# EAGLE design mem1 (EAGLE 4.13)
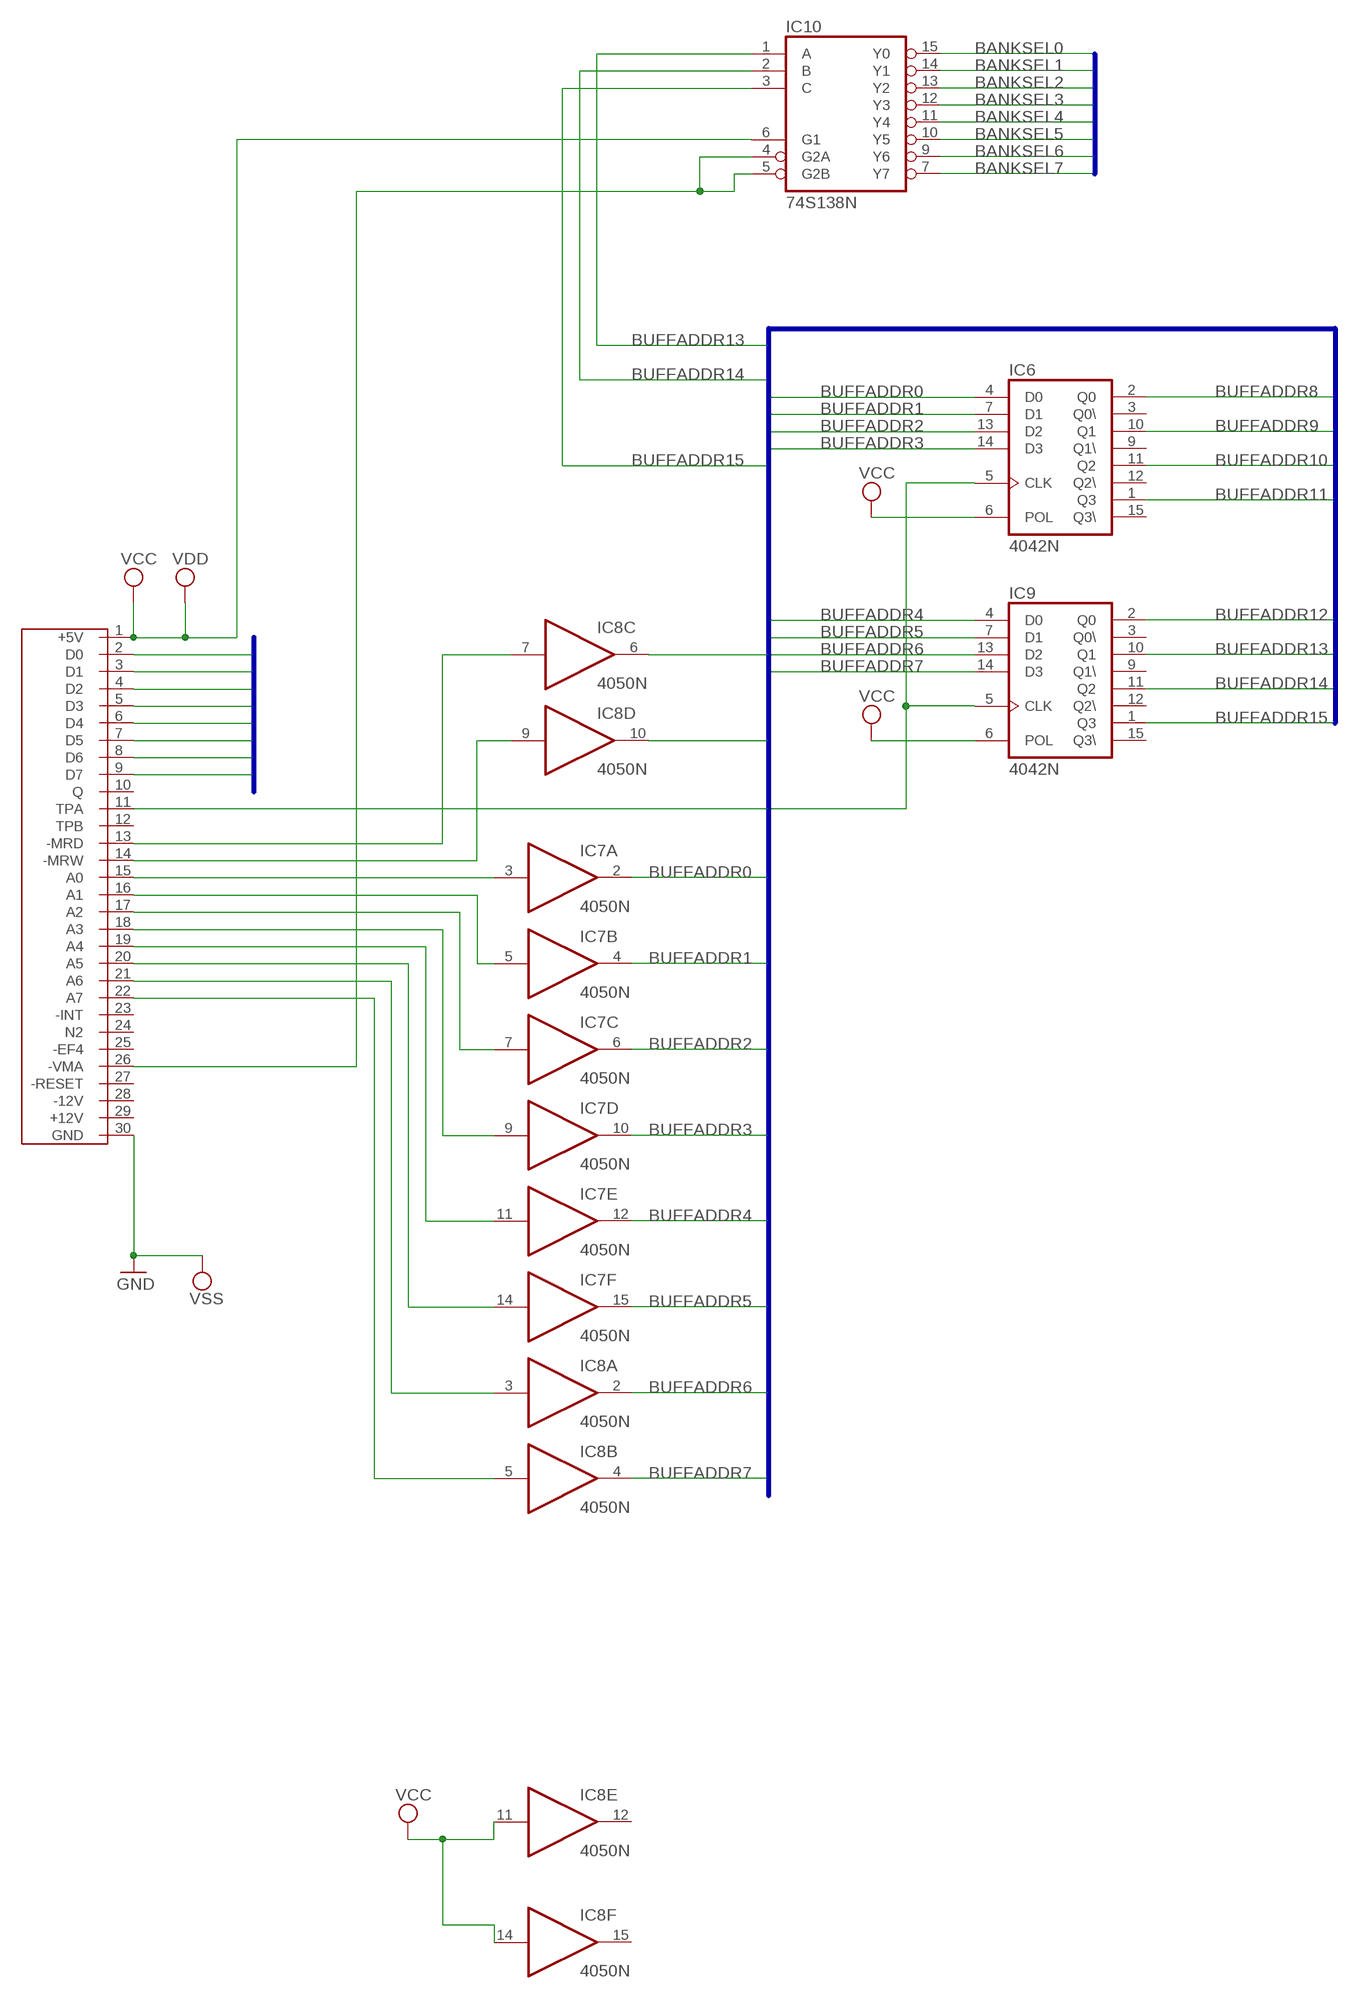
[diagram p0: schematic, sheet 1, part 1 of 2]
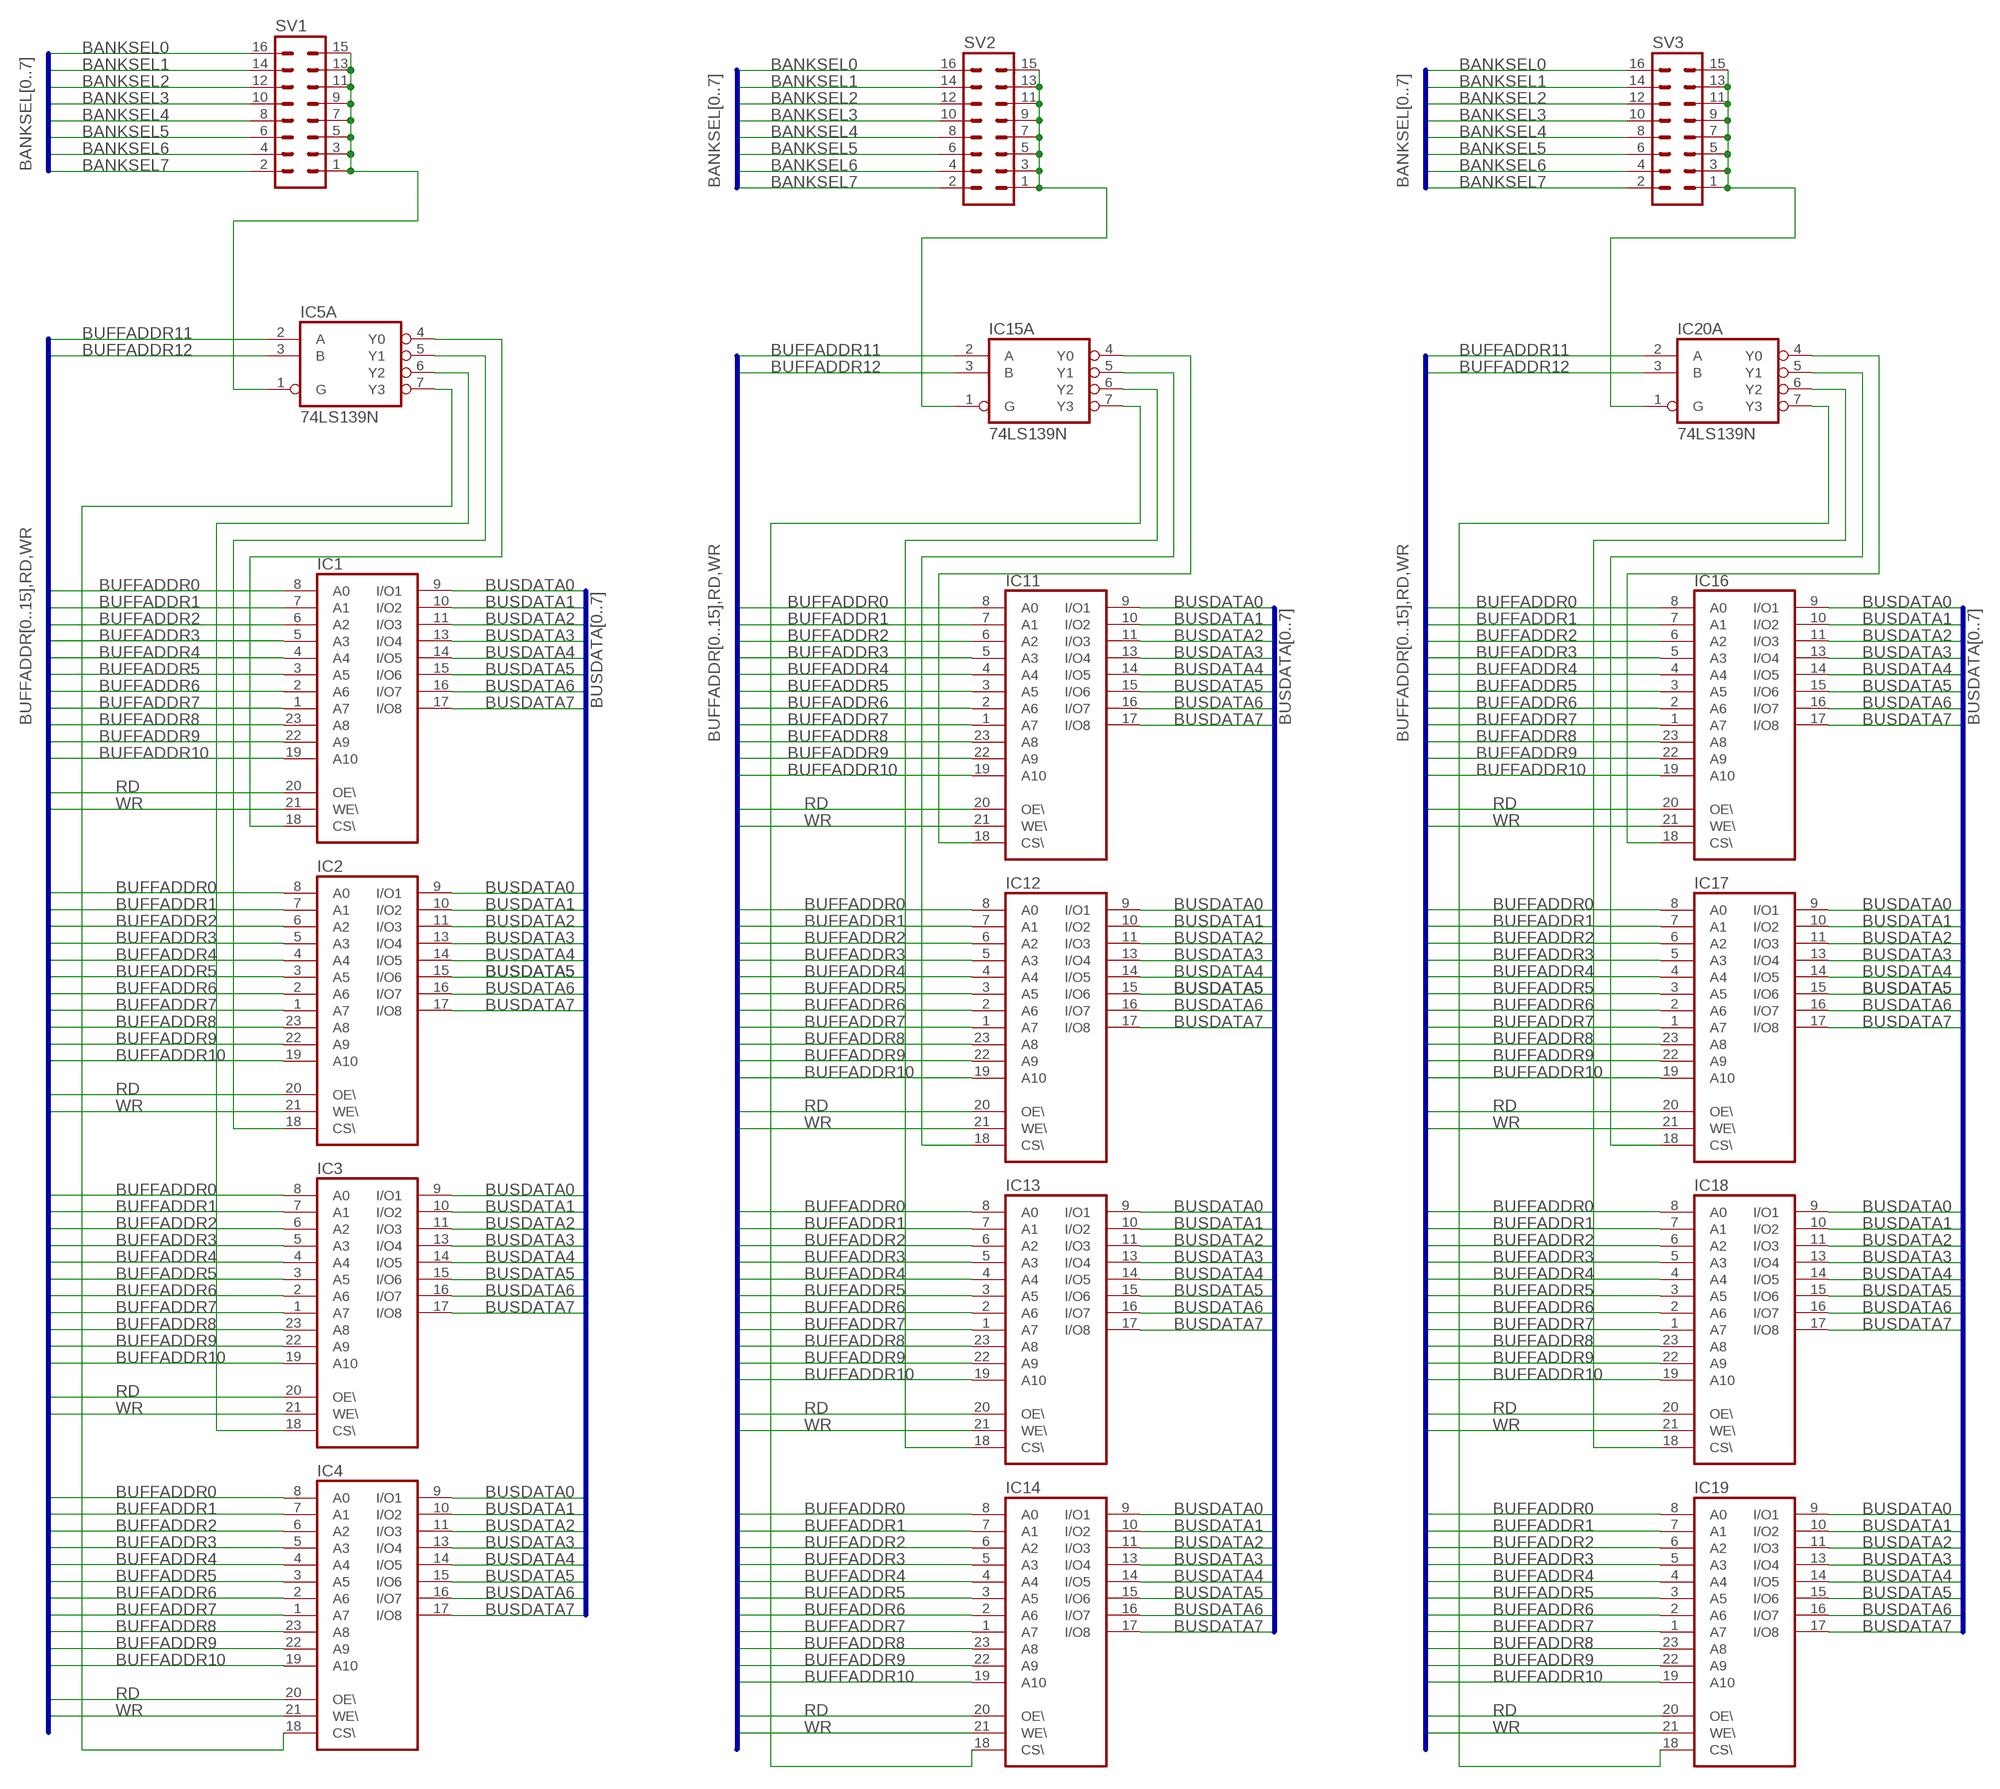
[diagram p1: schematic, sheet 1, part 2 of 2]

## Parts
IC1  6116P  [DIL24-6]
IC2  6116P  [DIL24-6]
IC3  6116P  [DIL24-6]
IC4  6116P  [DIL24-6]
IC5  74LS139N  [DIL16]
IC6  4042N  [DIL16]
IC7  4050N  [DIL16]
IC8  4050N  [DIL16]
IC9  4042N  [DIL16]
IC10  74S138N  [DIL16]
IC11  6116P  [DIL24-6]
IC12  6116P  [DIL24-6]
IC13  6116P  [DIL24-6]
IC14  6116P  [DIL24-6]
IC15  74LS139N  [DIL16]
IC16  6116P  [DIL24-6]
IC17  6116P  [DIL24-6]
IC18  6116P  [DIL24-6]
IC19  6116P  [DIL24-6]
IC20  74LS139N  [DIL16]
SV1  MA08-2  [MA08-2]
SV2  MA08-2  [MA08-2]
SV3  MA08-2  [MA08-2]
U$1  C30  [C30]

## Nets
BANKSEL0: IC10.15(Y0) SV1.16 SV2.16 SV3.16
BANKSEL1: IC10.14(Y1) SV1.14 SV2.14 SV3.14
BANKSEL2: IC10.13(Y2) SV1.12 SV2.12 SV3.12
BANKSEL3: IC10.12(Y3) SV1.10 SV2.10 SV3.10
BANKSEL4: IC10.11(Y4) SV1.8 SV2.8 SV3.8
BANKSEL5: IC10.10(Y5) SV1.6 SV2.6 SV3.6
BANKSEL6: IC10.9(Y6) SV1.4 SV2.4 SV3.4
BANKSEL7: IC10.7(Y7) SV1.2 SV2.2 SV3.2
BUFFADDR0: IC1.8(A0) IC2.8(A0) IC3.8(A0) IC4.8(A0) IC6.4(D0) IC7.2(A:O) IC11.8(A0) IC12.8(A0) IC13.8(A0) IC14.8(A0) IC16.8(A0) IC17.8(A0) IC18.8(A0) IC19.8(A0)
BUFFADDR1: IC1.7(A1) IC2.7(A1) IC3.7(A1) IC4.7(A1) IC6.7(D1) IC7.4(B:O) IC11.7(A1) IC12.7(A1) IC13.7(A1) IC14.7(A1) IC16.7(A1) IC17.7(A1) IC18.7(A1) IC19.7(A1)
BUFFADDR2: IC1.6(A2) IC2.6(A2) IC3.6(A2) IC4.6(A2) IC6.13(D2) IC7.6(C:O) IC11.6(A2) IC12.6(A2) IC13.6(A2) IC14.6(A2) IC16.6(A2) IC17.6(A2) IC18.6(A2) IC19.6(A2)
BUFFADDR3: IC1.5(A3) IC2.5(A3) IC3.5(A3) IC4.5(A3) IC6.14(D3) IC7.10(D:O) IC11.5(A3) IC12.5(A3) IC13.5(A3) IC14.5(A3) IC16.5(A3) IC17.5(A3) IC18.5(A3) IC19.5(A3)
BUFFADDR4: IC1.4(A4) IC2.4(A4) IC3.4(A4) IC4.4(A4) IC7.12(E:O) IC9.4(D0) IC11.4(A4) IC12.4(A4) IC13.4(A4) IC14.4(A4) IC16.4(A4) IC17.4(A4) IC18.4(A4) IC19.4(A4)
BUFFADDR5: IC1.3(A5) IC2.3(A5) IC3.3(A5) IC4.3(A5) IC7.15(F:O) IC9.7(D1) IC11.3(A5) IC12.3(A5) IC13.3(A5) IC14.3(A5) IC16.3(A5) IC17.3(A5) IC18.3(A5) IC19.3(A5)
BUFFADDR6: IC1.2(A6) IC2.2(A6) IC3.2(A6) IC4.2(A6) IC8.2(A:O) IC9.13(D2) IC11.2(A6) IC12.2(A6) IC13.2(A6) IC14.2(A6) IC16.2(A6) IC17.2(A6) IC18.2(A6) IC19.2(A6)
BUFFADDR7: IC1.1(A7) IC2.1(A7) IC3.1(A7) IC4.1(A7) IC8.4(B:O) IC9.14(D3) IC11.1(A7) IC12.1(A7) IC13.1(A7) IC14.1(A7) IC16.1(A7) IC17.1(A7) IC18.1(A7) IC19.1(A7)
BUFFADDR8: IC1.23(A8) IC2.23(A8) IC3.23(A8) IC4.23(A8) IC6.2(Q0) IC11.23(A8) IC12.23(A8) IC13.23(A8) IC14.23(A8) IC16.23(A8) IC17.23(A8) IC18.23(A8) IC19.23(A8)
BUFFADDR9: IC1.22(A9) IC2.22(A9) IC3.22(A9) IC4.22(A9) IC6.10(Q1) IC11.22(A9) IC12.22(A9) IC13.22(A9) IC14.22(A9) IC16.22(A9) IC17.22(A9) IC18.22(A9) IC19.22(A9)
BUFFADDR10: IC1.19(A10) IC2.19(A10) IC3.19(A10) IC4.19(A10) IC6.11(Q2) IC11.19(A10) IC12.19(A10) IC13.19(A10) IC14.19(A10) IC16.19(A10) IC17.19(A10) IC18.19(A10) IC19.19(A10)
BUFFADDR11: IC5.2(A:A) IC6.1(Q3) IC15.2(A:A) IC20.2(A:A)
BUFFADDR12: IC5.3(A:B) IC9.2(Q0) IC15.3(A:B) IC20.3(A:B)
BUFFADDR13: IC9.10(Q1) IC10.1(A)
BUFFADDR14: IC9.11(Q2) IC10.2(B)
BUFFADDR15: IC9.1(Q3) IC10.3(C)
BUSDATA0: IC1.9(I/O1) IC2.9(I/O1) IC3.9(I/O1) IC4.9(I/O1) IC11.9(I/O1) IC12.9(I/O1) IC13.9(I/O1) IC14.9(I/O1) IC16.9(I/O1) IC17.9(I/O1) IC18.9(I/O1) IC19.9(I/O1) U$1.2(D0)
BUSDATA1: IC1.10(I/O2) IC2.10(I/O2) IC3.10(I/O2) IC4.10(I/O2) IC11.10(I/O2) IC12.10(I/O2) IC13.10(I/O2) IC14.10(I/O2) IC16.10(I/O2) IC17.10(I/O2) IC18.10(I/O2) IC19.10(I/O2) U$1.3(D1)
BUSDATA2: IC1.11(I/O3) IC2.11(I/O3) IC3.11(I/O3) IC4.11(I/O3) IC11.11(I/O3) IC12.11(I/O3) IC13.11(I/O3) IC14.11(I/O3) IC16.11(I/O3) IC17.11(I/O3) IC18.11(I/O3) IC19.11(I/O3) U$1.4(D2)
BUSDATA3: IC1.13(I/O4) IC2.13(I/O4) IC3.13(I/O4) IC4.13(I/O4) IC11.13(I/O4) IC12.13(I/O4) IC13.13(I/O4) IC14.13(I/O4) IC16.13(I/O4) IC17.13(I/O4) IC18.13(I/O4) IC19.13(I/O4) U$1.5(D3)
BUSDATA4: IC1.14(I/O5) IC2.14(I/O5) IC3.14(I/O5) IC4.14(I/O5) IC11.14(I/O5) IC12.14(I/O5) IC13.14(I/O5) IC14.14(I/O5) IC16.14(I/O5) IC17.14(I/O5) IC18.14(I/O5) IC19.14(I/O5) U$1.6(D4)
BUSDATA5: IC1.15(I/O6) IC2.15(I/O6) IC3.15(I/O6) IC4.15(I/O6) IC11.15(I/O6) IC12.15(I/O6) IC13.15(I/O6) IC14.15(I/O6) IC16.15(I/O6) IC17.15(I/O6) IC18.15(I/O6) IC19.15(I/O6) U$1.7(D5)
BUSDATA6: IC1.16(I/O7) IC2.16(I/O7) IC3.16(I/O7) IC4.16(I/O7) IC11.16(I/O7) IC12.16(I/O7) IC13.16(I/O7) IC14.16(I/O7) IC16.16(I/O7) IC17.16(I/O7) IC18.16(I/O7) IC19.16(I/O7) U$1.8(D6)
BUSDATA7: IC1.17(I/O8) IC2.17(I/O8) IC3.17(I/O8) IC4.17(I/O8) IC11.17(I/O8) IC12.17(I/O8) IC13.17(I/O8) IC14.17(I/O8) IC16.17(I/O8) IC17.17(I/O8) IC18.17(I/O8) IC19.17(I/O8) U$1.9(D7)
GND: U$1.30(GND) ; supply symbol labelled VSS
N$1: IC1.18(CS\) IC5.4(A:Y0)
N$2: IC2.18(CS\) IC5.5(A:Y1)
N$3: IC3.18(CS\) IC5.6(A:Y2)
N$4: IC4.18(CS\) IC5.7(A:Y3)
N$5: IC6.5(CLK) IC9.5(CLK) U$1.11(TPA)
N$6: IC5.1(A:G) SV1.1 SV1.3 SV1.5 SV1.7 SV1.9 SV1.11 SV1.13 SV1.15
N$7: IC7.3(A:I) U$1.15(A0)
N$8: IC7.5(B:I) U$1.16(A1)
N$9: IC7.7(C:I) U$1.17(A2)
N$10: IC7.9(D:I) U$1.18(A3)
N$11: IC7.11(E:I) U$1.19(A4)
N$12: IC7.14(F:I) U$1.20(A5)
N$13: IC8.3(A:I) U$1.21(A6)
N$14: IC8.5(B:I) U$1.22(A7)
N$15: IC11.18(CS\) IC15.4(A:Y0)
N$16: IC12.18(CS\) IC15.5(A:Y1)
N$17: IC13.18(CS\) IC15.6(A:Y2)
N$18: IC14.18(CS\) IC15.7(A:Y3)
N$19: IC15.1(A:G) SV2.1 SV2.3 SV2.5 SV2.7 SV2.9 SV2.11 SV2.13 SV2.15
N$20: IC16.18(CS\) IC20.4(A:Y0)
N$21: IC17.18(CS\) IC20.5(A:Y1)
N$22: IC18.18(CS\) IC20.6(A:Y2)
N$23: IC19.18(CS\) IC20.7(A:Y3)
N$24: IC20.1(A:G) SV3.1 SV3.3 SV3.5 SV3.7 SV3.9 SV3.11 SV3.13 SV3.15
N$25: IC8.9(D:I) U$1.14(-MRW)
N$26: IC8.7(C:I) U$1.13(-MRD)
N$27: IC10.4(G2A) IC10.5(G2B) U$1.26(-VMA)
RD: IC1.20(OE\) IC2.20(OE\) IC3.20(OE\) IC4.20(OE\) IC8.6(C:O) IC11.20(OE\) IC12.20(OE\) IC13.20(OE\) IC14.20(OE\) IC16.20(OE\) IC17.20(OE\) IC18.20(OE\) IC19.20(OE\)
VCC: IC6.6(POL) IC8.11(E:I) IC8.14(F:I) IC9.6(POL) IC10.6(G1) U$1.1(+5V) ; supply symbol labelled VDD
WR: IC1.21(WE\) IC2.21(WE\) IC3.21(WE\) IC4.21(WE\) IC8.10(D:O) IC11.21(WE\) IC12.21(WE\) IC13.21(WE\) IC14.21(WE\) IC16.21(WE\) IC17.21(WE\) IC18.21(WE\) IC19.21(WE\)
Unconnected: IC5.9(B:Y3) IC5.10(B:Y2) IC5.11(B:Y1) IC5.12(B:Y0) IC5.13(B:B) IC5.14(B:A) IC5.15(B:G) IC6.3(Q0\) IC6.9(Q1\) IC6.12(Q2\) IC6.15(Q3\) IC8.12(E:O) IC8.15(F:O) IC9.3(Q0\) IC9.9(Q1\) IC9.12(Q2\) IC9.15(Q3\) IC15.9(B:Y3) IC15.10(B:Y2) IC15.11(B:Y1) IC15.12(B:Y0) IC15.13(B:B) IC15.14(B:A) IC15.15(B:G) IC20.9(B:Y3) IC20.10(B:Y2) IC20.11(B:Y1) IC20.12(B:Y0) IC20.13(B:B) IC20.14(B:A) IC20.15(B:G) U$1.10(Q) U$1.12(TPB) U$1.23(-INT) U$1.24(N2) U$1.25(-EF4) U$1.27(-RESET)

## Buses
BUFFADDR[0..15],RD,WR
BUSDATA[0..7]
BANKSEL[0..7]

## Power pins joined to a net without a drawn wire
+12V: U$1.29(+12V)
-12V: U$1.28(-12V)
GND: IC1.12(GND) IC2.12(GND) IC3.12(GND) IC4.12(GND) IC5.8(P:GND) IC10.8(GND) IC11.12(GND) IC12.12(GND) IC13.12(GND) IC14.12(GND) IC15.8(P:GND) IC16.12(GND) IC17.12(GND) IC18.12(GND) IC19.12(GND) IC20.8(P:GND)
VCC: IC1.24(VCC) IC2.24(VCC) IC3.24(VCC) IC4.24(VCC) IC5.16(P:VCC) IC10.16(VCC) IC11.24(VCC) IC12.24(VCC) IC13.24(VCC) IC14.24(VCC) IC15.16(P:VCC) IC16.24(VCC) IC17.24(VCC) IC18.24(VCC) IC19.24(VCC) IC20.16(P:VCC)
VDD: IC6.16(VDD) IC7.1(P:VDD) IC8.1(P:VDD) IC9.16(VDD)
VSS: IC6.8(VSS) IC7.8(P:VSS) IC8.8(P:VSS) IC9.8(VSS)

## Library data of the parts
IC1-IC4 IC11-IC14 IC16-IC19 = memory-idt:6116P: MEMORY
IC5 IC15 IC20 = 74xx-us:74*139: Dual 2-line to 4-line DECODER/DEMULTIPLEXER
IC6 IC9 = 40xx:4042: Quad clocked D LATCH
IC7 IC8 = 40xx:4050: Hex non-inverting BUFFER
IC10 = 74xx-us:74*138: 3-line to 8-line DECODER/DEMULTIPLEXER
SV1-SV3 = con-lstb:MA08-2: PIN HEADER
U$1 = k1:C30

## Board
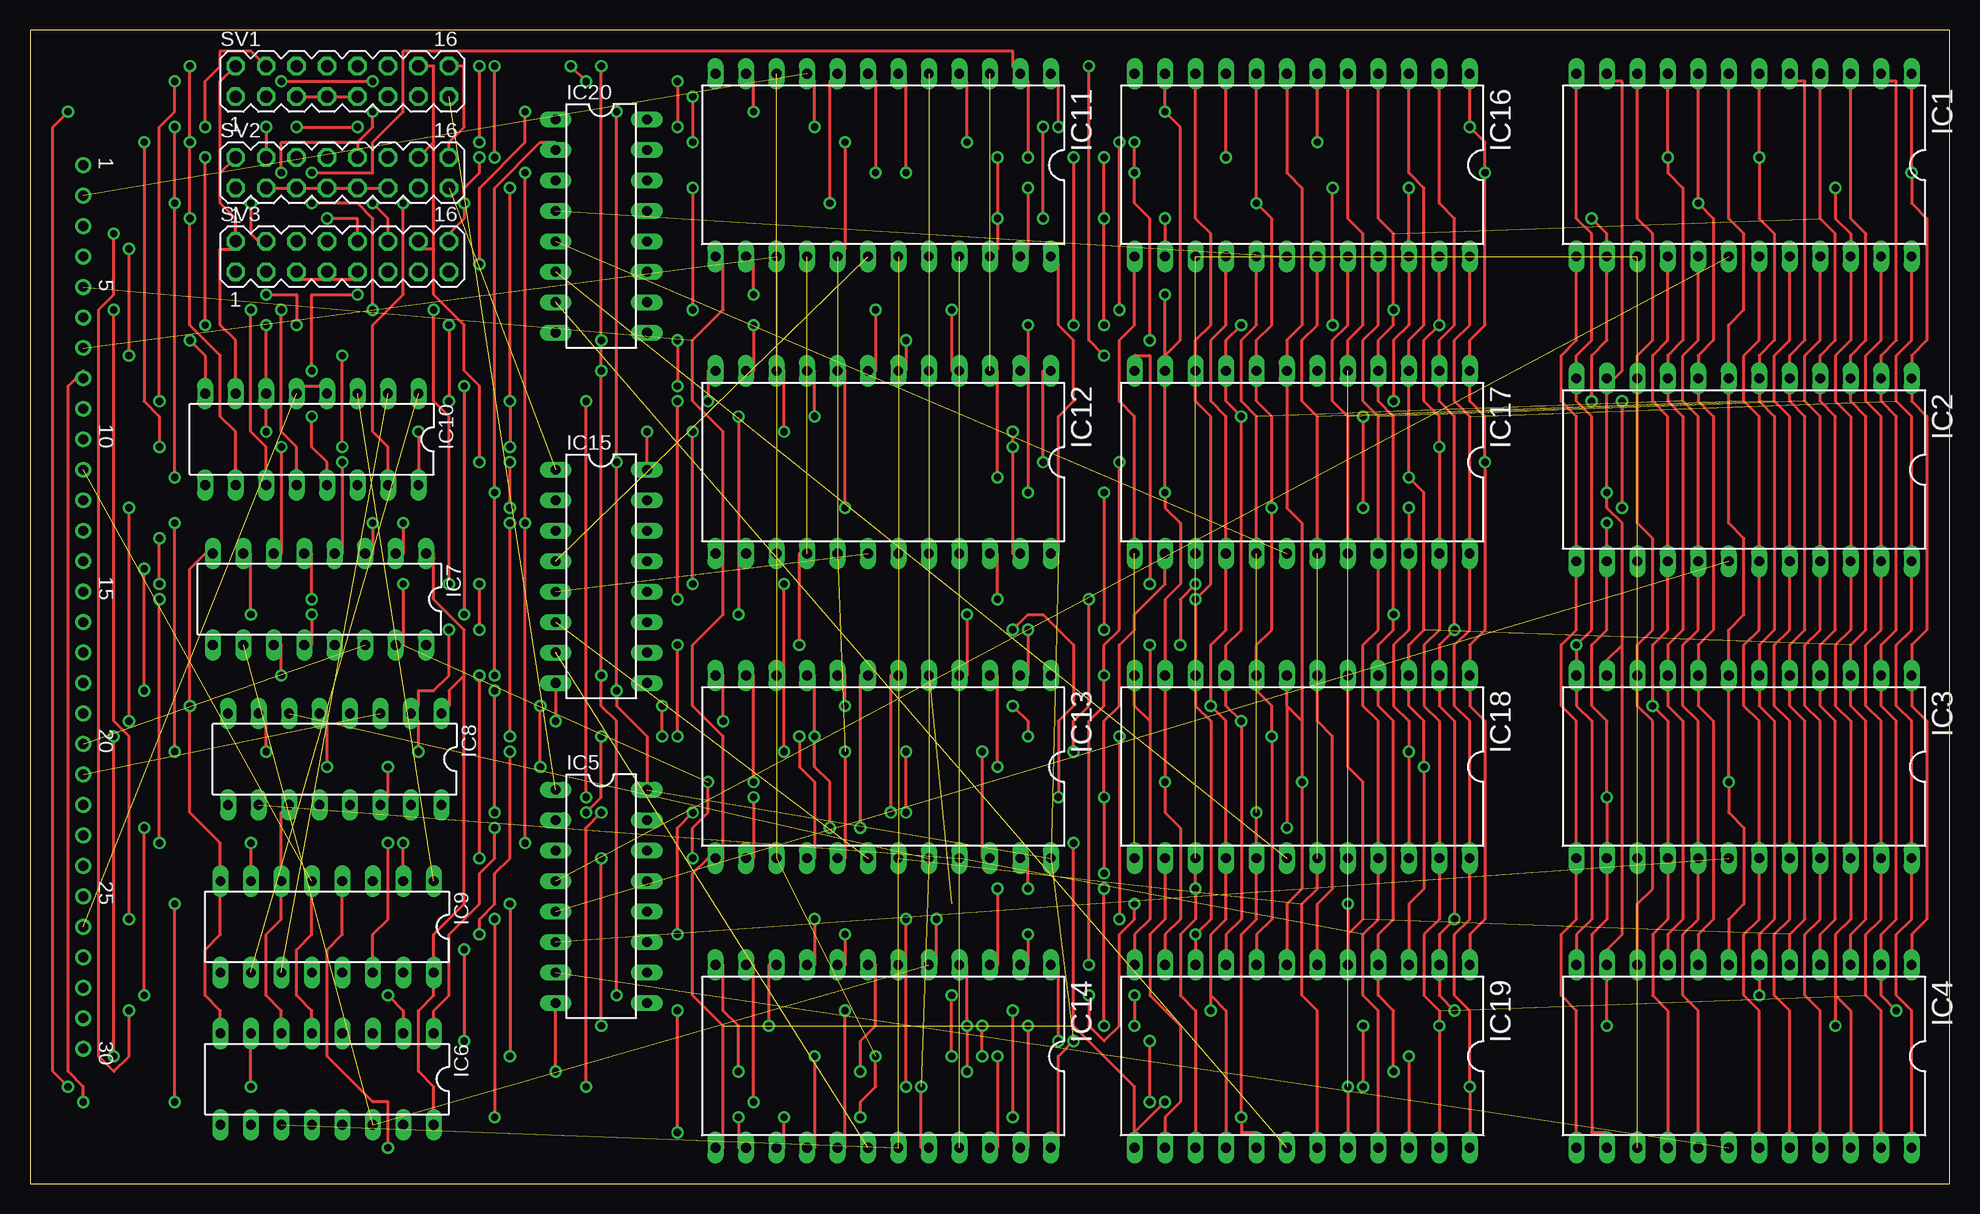
[diagram p2: board, top side]
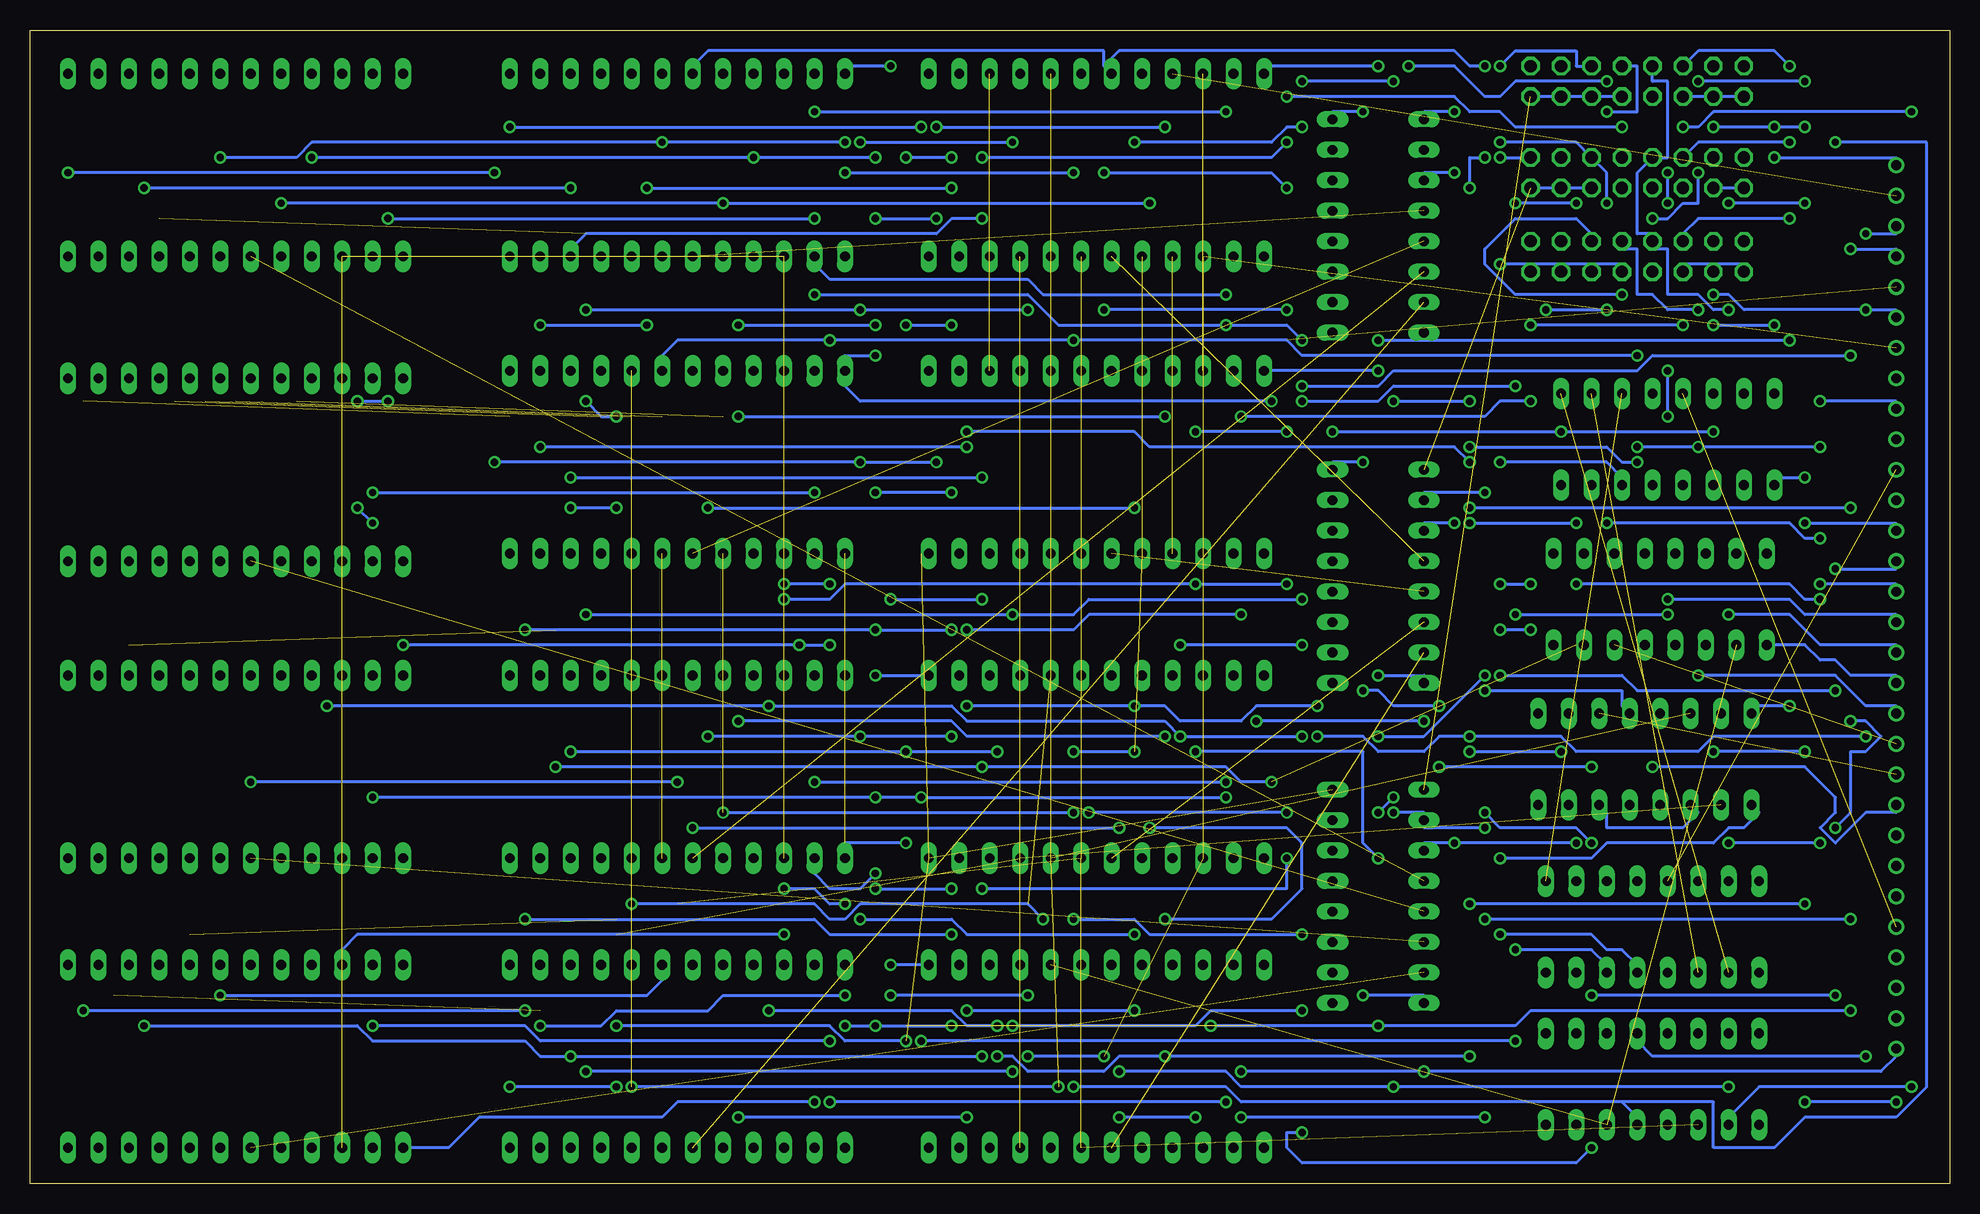
[diagram p3: board, bottom side, seen from below]

Size 160 x 96.19 mm. Coordinates in mm from the lower left corner, seen from the top.
Outline: 0,0 160,0 160,96.19 0,96.19 0,0
Copper layers (1*16): Top 0.035mm / dielectric 1.5mm / Bottom 0.035mm
Design rules "default": minimum track width 10mil, minimum drill 24mil, track to track 8mil, track to pad 8mil, pad to pad 8mil, via to via 8mil, smd to smd 8mil, copper to edge 40mil, drill to drill 8mil, minimum pad ring 10mil, minimum via ring 8mil, stop-mask expansion 4mil, vias tented up to drill 0mil, thermal gap 10mil

### Footprints (pad centres in the part's own frame; a part is rotated, then mirrored left to right if it is on the bottom)
DIL24-6 = drill 0.813 long: 1 -13.97,-7.62; 2 -11.43,-7.62; 3 -8.89,-7.62; 4 -6.35,-7.62; 5 -3.81,-7.62; 6 -1.27,-7.62; 7 1.27,-7.62; 8 3.81,-7.62; 9 6.35,-7.62; 10 8.89,-7.62; 11 11.43,-7.62; 12 13.97,-7.62; 13 13.97,7.62; 14 11.43,7.62; 15 8.89,7.62; 16 6.35,7.62; 17 3.81,7.62; 18 1.27,7.62; 19 -1.27,7.62; 20 -3.81,7.62; 21 -6.35,7.62; 22 -8.89,7.62; 23 -11.43,7.62; 24 -13.97,7.62
DIL16 = drill 0.813 long: 1 -8.89,-3.81; 2 -6.35,-3.81; 3 -3.81,-3.81; 4 -1.27,-3.81; 5 1.27,-3.81; 6 3.81,-3.81; 7 6.35,-3.81; 8 8.89,-3.81; 9 8.89,3.81; 10 6.35,3.81; 11 3.81,3.81; 12 1.27,3.81; 13 -1.27,3.81; 14 -3.81,3.81; 15 -6.35,3.81; 16 -8.89,3.81
MA08-2 = drill 1.016 octagon: 1 -8.89,-1.27; 2 -8.89,1.27; 3 -6.35,-1.27; 4 -6.35,1.27; 5 -3.81,-1.27; 6 -3.81,1.27; 7 -1.27,-1.27; 8 -1.27,1.27; 9 1.27,-1.27; 10 1.27,1.27; 11 3.81,-1.27; 12 3.81,1.27; 13 6.35,-1.27; 14 6.35,1.27; 15 8.89,-1.27; 16 8.89,1.27
C30 = drill 0.813 round: 1 -36.83,0; 2 -34.29,0; 3 -31.75,0; 4 -29.21,0; 5 -26.67,0; 6 -24.13,0; 7 -21.59,0; 8 -19.05,0; 9 -16.51,0; 10 -13.97,0; 11 -11.43,0; 12 -8.89,0; 13 -6.35,0; 14 -3.81,0; 15 -1.27,0; 16 1.27,0; 17 3.81,0; 18 6.35,0; 19 8.89,0; 20 11.43,0; 21 13.97,0; 22 16.51,0; 23 19.05,0; 24 21.59,0; 25 24.13,0; 26 26.67,0; 27 29.21,0; 28 31.75,0; 29 34.29,0; 30 36.83,0

### Placement (x,y rotation side)
IC1  142.87,84.92 180 top
IC2  142.87,59.52 180 top
IC3  142.87,34.76 180 top
IC4  142.87,10.63 180 top
IC5  47.62,23.96 270 top
IC6  24.76,8.73 180 top
IC7  24.12,48.73 180 top
IC8  25.39,35.39 180 top
IC9  24.76,21.42 180 top
IC10  23.49,62.06 180 top
IC11  71.11,84.92 180 top
IC12  71.11,60.16 180 top
IC13  71.11,34.76 180 top
IC14  71.11,10.63 180 top
IC15  47.62,50.63 270 top
IC16  106.04,84.92 180 top
IC17  106.04,60.16 180 top
IC18  106.04,34.76 180 top
IC19  106.04,10.63 180 top
IC20  47.62,79.84 270 top
SV1  26.03,91.91 0 top
SV2  26.03,84.29 0 top
SV3  26.03,77.3 0 top
U$1  4.44,48.09 270 top

### Tracks (layer width: path | path; a pad name or v marks a point on that pad's centre or on a via)
BANKSEL0  (via drill 0.61)
  Top 0.254: v37.46,85.56 37.46,84.29 36.19,83.02 v36.19,81.75 36.19,80.48 34.92,79.21 SV3.16 | v31.11,81.75 31.11,74.13 28.57,71.59 28.57,62.7 29.84,61.43 IC10.15 | SV1.16 36.19,93.18 36.19,88.1 34.92,86.83 SV2.16
  Bottom 0.254: v37.46,85.56 SV2.16 | v31.11,81.75 v36.19,81.75
BANKSEL1  (via drill 0.61)
  Top 0.254: 33.65,86.83 SV2.14 | 33.65,86.83 33.65,93.18 SV1.14 | 33.65,77.94 32.38,77.94 SV3.14 | 33.65,77.94 33.65,74.13 36.19,71.59 36.19,67.78 37.46,66.51 v37.46,60.16 | 33.65,77.94 33.65,86.83
  Bottom 0.254: v37.46,60.16 28.57,60.16 27.3,58.89 IC10.14
BANKSEL2  (via drill 0.61)
  Top 0.254: v37.46,86.83 v37.46,93.18 | v27.3,74.13 23.49,74.13 v23.49,67.78 | v23.49,63.97 23.49,61.43 24.76,60.16 IC10.13 | v28.57,81.75 29.84,80.48 SV3.12
  Bottom 0.254: v37.46,86.83 31.11,86.83 SV2.12 28.57,84.29 v28.57,81.75 | v37.46,93.18 36.19,94.45 31.11,94.45 31.11,93.18 SV1.12 | v27.3,74.13 36.19,74.13 38.73,76.67 38.73,77.94 36.19,80.48 31.11,80.48 29.84,79.21 SV3.12 | v23.49,63.97 v23.49,67.78
BANKSEL3  (via drill 0.61)
  Top 0.254: 27.3,86.83 SV2.10 | 27.3,86.83 28.57,88.1 v28.57,89.37 | v20.95,72.86 20.95,62.7 22.22,61.43 IC10.12 | 27.3,86.83 20.95,86.83 v20.95,84.29 | v24.76,80.48 27.3,80.48 SV3.10
  Bottom 0.254: v28.57,89.37 26.03,89.37 26.03,93.18 SV1.10 | v20.95,72.86 23.49,72.86 24.76,74.13 26.03,74.13 26.03,77.94 27.3,77.94 SV3.10 | v20.95,84.29 20.95,81.75 22.22,81.75 23.49,80.48 v24.76,80.48
BANKSEL4  (via drill 0.61)
  Top 0.254: v18.41,72.86 18.41,62.7 19.68,61.43 IC10.11
  Bottom 0.254: v18.41,72.86 19.68,72.86 20.95,74.13 23.49,74.13 23.49,77.94 24.76,77.94 SV3.8 24.76,79.21 26.03,79.21 26.03,84.29 SV2.8 23.49,85.56 23.49,91.91 24.76,91.91 SV1.8
BANKSEL5  (via drill 0.61)
  Top 0.254: IC10.10 17.14,62.7 15.87,63.97 15.87,69.05 13.33,71.59 v13.33,80.48 v13.33,86.83 v13.33,93.18
  Bottom 0.254: v13.33,80.48 20.95,80.48 22.22,79.21 SV3.6 | SV2.6 20.95,86.83 v13.33,86.83 | SV1.6 20.95,94.45 14.6,94.45 v13.33,93.18
BANKSEL6  (via drill 0.61)
  Top 0.254: v12.06,58.89 v12.06,81.75 v12.06,88.1 | v18.41,81.75 18.41,79.21 19.68,77.94 SV3.4 | v19.68,88.1 SV2.4 | SV1.4 18.41,94.45 15.87,94.45 15.87,93.18 14.6,91.91 v14.6,88.1
  Bottom 0.254: v12.06,58.89 14.6,58.89 IC10.9 | v12.06,81.75 v18.41,81.75 | v12.06,88.1 v14.6,88.1 v19.68,88.1
BANKSEL7
  Top 0.254: IC10.7 17.14,70.32 15.87,71.59 15.87,77.94 17.14,77.94 SV3.2 17.14,80.48 15.87,81.75 15.87,84.29 | 15.87,84.29 SV2.2 | SV1.2 15.87,91.91 15.87,84.29
BUFFADDR0  (via drill 0.61)
  Top 0.254: IC4.8 139.06,20.79 140.33,22.06 140.33,38.57 139.06,39.84 IC3.8 139.06,44.92 140.33,46.19 140.33,63.97 139.06,65.24 IC2.8 139.06,69.05 140.33,70.32 140.33,80.48 v139.06,81.75 IC1.8 | v66.67,81.75 66.67,91.91 IC11.8 | IC16.8 v102.23,81.75 103.5,80.48 103.5,71.59 102.23,70.32 IC17.8 102.23,65.24 103.5,63.97 v103.5,56.35 103.5,46.19 102.23,44.92 IC18.8 102.23,41.11 103.5,39.84 v103.5,37.3 103.5,22.06 102.23,20.79 IC19.8 | v6.98,10.63 v6.98,37.3 | v40,37.3 v40,55.08 | v31.11,55.08 31.11,52.54 IC7.2 | v67.94,56.35 67.94,67.78 IC12.8 | v67.94,20.79 67.94,18.25 IC14.8 | v90.8,37.3 v90.8,22.06 | v67.94,39.84 67.94,42.38 IC13.8 | v81.91,39.84 83.18,38.57 v83.18,37.3 | v52.7,37.3 v52.7,39.84
  Bottom 0.254: v66.67,81.75 v102.23,81.75 v139.06,81.75 | v6.98,10.63 24.76,10.63 26.03,11.9 IC6.4 | v6.98,37.3 19.68,37.3 20.95,36.03 31.11,36.03 32.38,37.3 v40,37.3 42.54,37.3 43.81,36.03 47.62,36.03 48.89,37.3 v52.7,37.3 | v40,55.08 v31.11,55.08 | v103.5,56.35 v67.94,56.35 | v67.94,20.79 81.91,20.79 83.18,22.06 v90.8,22.06 | v103.5,37.3 v90.8,37.3 v83.18,37.3 | v81.91,39.84 v67.94,39.84 65.4,39.84 64.13,38.57 59.05,38.57 57.78,39.84 v52.7,39.84
BUFFADDR1  (via drill 0.61)
  Top 0.254: v69.21,9.36 69.21,11.9 70.48,13.17 70.48,18.25 IC14.7 | v18.41,8.09 IC6.7 | v70.48,72.86 70.48,67.78 IC12.7 | v55.24,83.02 v55.24,72.86 | v70.48,84.29 70.48,91.91 IC11.7 | v26.03,60.16 26.03,52.54 IC7.4 | v40,83.02 v40,65.24 v40,61.43 | v38.73,85.56 v38.73,93.18 | v46.35,8.09 46.35,29.68 v47.62,30.95 | v46.35,32.22 v46.35,65.24 | 106.04,38.57 v106.04,33.49 106.04,24.6 104.77,23.33 IC19.7 | 106.04,38.57 104.77,39.84 | 104.77,39.84 IC18.7 | v69.21,29.68 69.21,42.38 IC13.7 | 104.77,39.84 v104.77,29.68 | 106.04,38.57 106.04,55.08 104.77,56.35 IC17.7 104.77,70.32 106.04,71.59 106.04,83.02 104.77,84.29 IC16.7 | IC4.7 141.6,22.06 142.87,23.33 142.87,29.68 141.6,30.95 v141.6,33.49 IC3.7 141.6,46.19 142.87,47.46 142.87,53.81 141.6,55.08 IC2.7 141.6,71.59 142.87,72.86 142.87,79.21 141.6,80.48 IC1.7
  Bottom 0.254: v18.41,8.09 v46.35,8.09 59.05,8.09 60.32,9.36 v69.21,9.36 | v55.24,72.86 v70.48,72.86 | v55.24,83.02 56.51,84.29 v70.48,84.29 | v26.03,60.16 27.3,60.16 28.57,61.43 v40,61.43 | v40,83.02 40,85.56 v38.73,85.56 | v38.73,93.18 40,93.18 41.27,94.45 69.21,94.45 70.48,93.18 | v47.62,30.95 v46.35,32.22 | v46.35,65.24 v40,65.24 | v104.77,29.68 v69.21,29.68 | v106.04,33.49 v141.6,33.49 | 70.48,93.18 70.48,94.45 103.5,94.45 104.77,93.18 IC16.7 | 70.48,93.18 IC11.7
BUFFADDR2  (via drill 0.61)
  Top 0.254: v73.02,84.29 73.02,91.91 IC11.6 | v92.07,86.83 v92.07,84.29 92.07,81.75 93.34,80.48 v93.34,70.32 | v107.31,86.83 IC16.6 | IC19.6 107.31,23.33 108.58,24.6 108.58,37.3 107.31,38.57 IC18.6 | IC1.6 v144.14,85.56 144.14,80.48 145.41,79.21 145.41,70.32 144.14,69.05 IC2.6 144.14,65.24 145.41,63.97 145.41,46.19 144.14,44.92 IC3.6 144.14,39.84 145.41,38.57 145.41,22.06 144.14,20.79 IC4.6 v144.14,15.71 | v73.02,8.09 73.02,18.25 | v71.75,30.95 71.75,42.38 IC13.6 | v55.24,30.95 53.97,29.68 v53.97,20.79 | 73.02,18.25 v73.02,22.06 | 73.02,18.25 IC14.6 | v73.02,70.32 73.02,67.78 IC12.6 | v20.95,61.43 20.95,52.54 IC7.6 | v26.03,61.43 v26.03,69.05 | v9.52,86.83 9.52,65.24 10.79,63.97 v10.79,61.43
  Bottom 0.254: v92.07,84.29 v73.02,84.29 | v92.07,86.83 v107.31,86.83 136.52,86.83 137.79,85.56 v144.14,85.56 | v144.14,15.71 108.58,15.71 107.31,16.98 IC19.6 | 27.3,6.82 26.03,5.55 IC6.13 | 27.3,6.82 59.05,6.82 60.32,8.09 v73.02,8.09 | v55.24,30.95 v71.75,30.95 | v53.97,20.79 66.67,20.79 67.94,22.06 v73.02,22.06 | IC17.6 107.31,69.05 106.04,70.32 v93.34,70.32 v73.02,70.32 55.24,70.32 53.97,69.05 v26.03,69.05 | v26.03,61.43 v20.95,61.43 v10.79,61.43 | 27.3,6.82 19.68,6.82 19.68,3.01 14.6,3.01 12.06,5.55 4.44,5.55 1.9,8.09 1.9,86.83 v9.52,86.83
BUFFADDR3  (via drill 0.61)  (7 unrouted)
  Top 0.254: 109.85,20.79 111.12,22.06 111.12,33.49 109.85,34.76 IC18.5 | 109.85,20.79 IC19.5 | v75.56,22.06 75.56,18.25 IC14.5 | v109.85,23.33 109.85,20.79 | IC4.5 146.68,20.79 147.95,22.06 147.95,38.57 146.68,39.84 IC3.5 146.68,44.92 147.95,46.19 147.95,63.97 146.68,65.24 IC2.5 146.68,69.05 147.95,70.32 147.95,91.91 146.68,91.91 IC1.5 | IC16.5 109.85,80.48 111.12,79.21 111.12,71.59 109.85,70.32 IC17.5
  Bottom 0.254: v75.56,22.06 76.83,23.33 90.8,23.33 92.07,22.06 93.34,22.06 94.61,23.33 v109.85,23.33
BUFFADDR4  (via drill 0.61)  (1 unrouted)
  Top 0.254: IC16.4 112.39,80.48 113.66,79.21 v113.66,72.86 113.66,71.59 112.39,70.32 IC17.4 112.39,65.24 113.66,63.97 v113.66,47.46 113.66,46.19 112.39,44.92 IC18.4 112.39,39.84 113.66,38.57 113.66,22.06 112.39,20.79 IC19.4 112.39,15.71 113.66,14.44 v113.66,9.36 | v78.1,9.36 v78.1,13.17 78.1,18.25 IC14.4 | v78.1,47.46 78.1,42.38 IC13.4 | v76.83,72.86 76.83,67.78 IC12.4 | v78.1,86.83 78.1,91.91 IC11.4 | v90.8,72.86 v90.8,86.83 | v23.49,47.46 23.49,44.92 IC7.12 | v36.19,66.51 v36.19,47.46 | v53.97,48.73 v53.97,65.24 | v29.84,3.01 29.84,6.82 28.57,6.82 24.76,10.63 24.76,19.52 26.03,20.79 IC9.4 | v53.97,4.28 v53.97,14.44 | IC4.4 149.22,20.79 150.49,22.06 150.49,38.57 149.22,39.84 IC3.4 149.22,44.92 150.49,46.19 150.49,63.97 149.22,65.24 IC2.4 149.22,69.05 150.49,70.32 150.49,79.21 149.22,80.48 IC1.4
  Bottom 0.254: v78.1,9.36 v113.66,9.36 | v113.66,47.46 v78.1,47.46 73.02,47.46 71.75,48.73 v53.97,48.73 | v113.66,72.86 v90.8,72.86 v76.83,72.86 | v90.8,86.83 v78.1,86.83 | v36.19,47.46 v23.49,47.46 | v36.19,66.51 46.35,66.51 47.62,65.24 v53.97,65.24 | v29.84,3.01 31.11,1.74 53.97,1.74 55.24,3.01 55.24,4.28 v53.97,4.28 | v53.97,14.44 61.59,14.44 62.86,13.17 v78.1,13.17
BUFFADDR5  (via drill 0.61)  (3 unrouted)
  Top 0.254: v80.64,24.6 80.64,18.25 IC14.3 | v55.24,27.14 55.24,29.68 56.51,30.95 v56.51,33.49 | v80.64,34.76 80.64,42.38 IC13.3 | IC19.3 114.93,23.33 116.2,24.6 v116.2,34.76 116.2,38.57 114.93,39.84 IC18.3 114.93,44.92 116.2,46.19 116.2,57.62 v114.93,58.89 IC17.3 114.93,70.32 116.2,71.59 116.2,83.02 114.93,84.29 IC16.3 | v80.64,58.89 80.64,67.78 IC12.3 | v10.79,28.41 v10.79,48.73 | v31.11,50 31.11,44.92 IC7.15 | v18.41,28.41 IC9.7 | IC4.3 151.76,20.79 153.03,22.06 153.03,38.57 151.76,39.84 IC3.3 151.76,44.92 153.03,46.19 153.03,63.97 151.76,65.24 IC2.3 151.76,69.05 153.03,70.32 153.03,79.21 151.76,80.48 IC1.3
  Bottom 0.254: v80.64,24.6 55.24,24.6 v55.24,27.14 | v56.51,33.49 59.05,33.49 60.32,34.76 v80.64,34.76 v116.2,34.76 | v114.93,58.89 v80.64,58.89 | v10.79,28.41 v18.41,28.41 | v10.79,48.73 12.06,48.73 13.33,50 v31.11,50
BUFFADDR6  (via drill 0.61)
  Top 0.254: IC1.2 154.3,91.91 155.57,91.91 155.57,70.32 154.3,69.05 IC2.2 154.3,65.24 155.57,63.97 155.57,46.19 154.3,44.92 IC3.2 154.3,39.84 155.57,38.57 155.57,22.06 154.3,20.79 IC4.2 154.3,15.71 v155.57,14.44 | v83.18,20.79 83.18,18.25 IC14.2 | v37.46,20.79 37.46,22.06 38.73,23.33 38.73,25.87 40,27.14 v40,36.03 | v32.38,36.03 32.38,38.57 IC8.2 32.38,39.84 32.38,41.11 33.65,41.11 34.92,42.38 v34.92,46.19 | v83.18,46.19 83.18,42.38 IC13.2 | 83.18,67.78 v83.18,57.62 | v89.53,57.62 v89.53,46.19 | v83.18,85.56 83.18,91.91 IC11.2 81.91,93.18 81.91,94.45 31.11,94.45 31.11,89.37 28.57,86.83 28.57,84.29 v23.49,84.29 | v86.99,85.56 v86.99,71.59 | v83.18,71.59 83.18,67.78 | 83.18,67.78 IC12.2 | IC16.2 117.47,81.75 118.74,80.48 118.74,71.59 117.47,70.32 IC17.2 117.47,65.24 118.74,63.97 v118.74,46.19 117.47,44.92 IC18.2 117.47,39.84 118.74,38.57 v118.74,22.06 117.47,20.79 IC19.2 117.47,15.71 v118.74,14.44 | v37.46,46.19 v37.46,50 | v34.92,50 34.92,63.97 33.65,65.24 v33.65,72.86 | v28.57,72.86 28.57,80.48 27.3,81.75 v23.49,81.75
  Bottom 0.254: v83.18,20.79 93.34,20.79 94.61,22.06 v118.74,22.06 | v37.46,20.79 29.84,20.79 28.57,19.52 27.3,19.52 26.03,18.25 IC9.13 | v40,36.03 v32.38,36.03 | v118.74,46.19 v89.53,46.19 v83.18,46.19 | v83.18,57.62 v89.53,57.62 | v83.18,85.56 v86.99,85.56 | v86.99,71.59 v83.18,71.59 | v34.92,46.19 v37.46,46.19 | v37.46,50 v34.92,50 | v33.65,72.86 v28.57,72.86 | v23.49,81.75 v23.49,84.29 | v118.74,14.44 v155.57,14.44
BUFFADDR7  (via drill 0.61)
  Top 0.254: v88.26,18.25 88.26,38.57 89.53,39.84 v89.53,42.38 89.53,44.92 90.8,46.19 v90.8,60.16 | v36.19,19.52 v36.19,11.9 | v85.72,11.9 85.72,18.25 IC14.1 | v38.73,30.95 v38.73,41.11 | v29.84,28.41 29.84,22.06 28.57,20.79 IC9.14 | v84.45,60.16 84.45,67.78 IC12.1 | IC4.1 156.84,20.79 158.11,22.06 158.11,38.57 156.84,39.84 IC3.1 156.84,44.92 158.11,46.19 158.11,63.97 156.84,65.24 IC2.1 156.84,69.05 158.11,70.32 158.11,80.48 156.84,81.75 v156.84,84.29 IC1.1 | v85.72,88.1 85.72,91.91 IC11.1 | IC16.1 v120.01,88.1 121.28,86.83 v121.28,84.29 121.28,71.59 120.01,70.32 IC17.1 120.01,65.24 121.28,63.97 v121.28,60.16 121.28,46.19 120.01,44.92 IC18.1 120.01,39.84 121.28,38.57 121.28,22.06 120.01,20.79 IC19.1
  Bottom 0.254: IC14.1 v88.26,18.25 | v89.53,42.38 IC13.1 | v36.19,19.52 29.84,19.52 28.57,18.25 IC9.14 | v36.19,11.9 v85.72,11.9 | v38.73,41.11 27.3,41.11 27.3,39.84 IC8.4 | v38.73,30.95 37.46,29.68 31.11,29.68 v29.84,28.41 | v84.45,60.16 v90.8,60.16 v121.28,60.16 | v120.01,88.1 v85.72,88.1 | v121.28,84.29 v156.84,84.29
BUFFADDR8  (via drill 0.61)  (1 unrouted)
  Top 0.254: v83.18,13.17 83.18,3.01 IC14.23 | v89.53,13.17 v89.53,24.6 | v83.18,24.6 83.18,27.14 IC13.23 | IC19.23 v117.47,13.17 117.47,14.44 116.2,15.71 116.2,20.79 117.47,22.06 IC18.23 117.47,38.57 116.2,39.84 116.2,44.92 117.47,46.19 IC17.23 v117.47,61.43 117.47,63.97 116.2,65.24 116.2,70.32 v117.47,71.59 IC16.23 | v92.07,15.71 v92.07,13.17 | v29.84,15.71 31.11,14.44 IC6.2 | v9.52,15.71 v9.52,29.68 | v8.25,38.57 v8.25,56.35 | v40,56.35 v40,60.16 | v81.91,62.7 v81.91,61.43 81.91,52.54 IC12.23 | IC4.23 154.3,14.44 153.03,15.71 153.03,20.79 154.3,22.06 IC3.23 154.3,38.57 153.03,39.84 153.03,44.92 154.3,46.19 IC2.23 154.3,63.97 153.03,65.24 153.03,69.05 154.3,70.32 IC1.23 | v83.18,83.02 83.18,77.94 IC11.23 | v108.58,71.59 v108.58,83.02
  Bottom 0.254: v83.18,13.17 v89.53,13.17 v92.07,13.17 | v89.53,24.6 v83.18,24.6 | v92.07,15.71 102.23,15.71 103.5,14.44 111.12,14.44 112.39,13.17 v117.47,13.17 | v9.52,15.71 v29.84,15.71 | v9.52,29.68 8.25,30.95 8.25,36.03 6.98,36.03 5.71,37.3 6.98,38.57 v8.25,38.57 | v8.25,56.35 v40,56.35 | v40,60.16 41.27,61.43 66.67,61.43 67.94,62.7 v81.91,62.7 | v81.91,61.43 v117.47,61.43 | v108.58,83.02 v83.18,83.02 | v117.47,71.59 v108.58,71.59
BUFFADDR9  (via drill 0.61)
  Top 0.254: IC18.22 v114.93,36.03 114.93,38.57 113.66,39.84 113.66,44.92 114.93,46.19 IC17.22 v114.93,56.35 | v79.37,36.03 79.37,27.14 IC13.22 | v80.64,48.73 80.64,52.54 IC12.22 | v88.26,48.73 88.26,39.84 86.99,38.57 v86.99,36.03 | v113.66,65.24 113.66,70.32 114.93,71.59 IC16.22 v114.93,83.02 | v111.12,63.97 v111.12,56.35 | v80.64,10.63 80.64,3.01 IC14.22 | v114.93,10.63 IC19.22 | 150.49,15.71 150.49,20.79 151.76,22.06 IC3.22 151.76,38.57 150.49,39.84 150.49,44.92 151.76,46.19 IC2.22 151.76,63.97 150.49,65.24 150.49,69.05 151.76,70.32 IC1.22 151.76,79.21 150.49,80.48 v150.49,83.02 | 150.49,15.71 151.76,14.44 IC4.22 | 150.49,15.71 v150.49,13.17 | v3.17,8.09 1.9,9.36 1.9,88.1 v3.17,89.37 | v22.22,88.1 v27.3,88.1 | v55.24,90.64 v55.24,86.83 | v80.64,85.56 v80.64,80.48 80.64,77.94 IC11.22
  Bottom 0.254: v114.93,36.03 v86.99,36.03 v79.37,36.03 | v88.26,48.73 v80.64,48.73 | v113.66,65.24 112.39,63.97 v111.12,63.97 | v111.12,56.35 v114.93,56.35 | v80.64,10.63 v114.93,10.63 117.47,10.63 118.74,11.9 131.44,11.9 132.71,13.17 v150.49,13.17 | v114.93,83.02 v150.49,83.02 | v3.17,8.09 15.87,8.09 18.41,5.55 IC6.10 | v3.17,89.37 19.68,89.37 20.95,88.1 v22.22,88.1 | v27.3,88.1 36.19,88.1 37.46,89.37 40,89.37 41.27,90.64 v55.24,90.64 | v55.24,86.83 56.51,85.56 v80.64,85.56 | v80.64,80.48 83.18,80.48 84.45,79.21 113.66,79.21 114.93,77.94 IC16.22
BUFFADDR10  (7 unrouted)
  Top 0.254: IC4.19 144.14,14.44 142.87,15.71 142.87,20.79 144.14,22.06 IC3.19 144.14,38.57 142.87,39.84 142.87,44.92 144.14,46.19 IC2.19 144.14,63.97 142.87,65.24 142.87,69.05 144.14,70.32 IC1.19 | IC18.19 107.31,24.6 106.04,23.33 106.04,15.71 107.31,14.44 IC19.19 | IC16.19 107.31,71.59 106.04,70.32 106.04,65.24 107.31,63.97 IC17.19
BUFFADDR11  (via drill 0.61)
  Top 0.254: v38.73,29.68 38.73,27.14 37.46,25.87 37.46,23.33 34.92,20.79 34.92,15.71 33.65,14.44 IC6.1 | IC20.2 43.81,86.83 42.54,86.83 38.73,83.02 v38.73,57.62 v38.73,42.38 | v46.35,30.95 47.62,32.22 v47.62,37.3
  Bottom 0.254: v38.73,29.68 43.81,29.68 IC5.2 43.81,30.95 v46.35,30.95 | v38.73,57.62 43.81,57.62 IC15.2 | v47.62,37.3 43.81,37.3 v38.73,42.38
BUFFADDR12  (via drill 0.61)
  Top 0.254: IC9.2 v31.11,28.41 | v41.27,84.29 v41.27,55.08 v41.27,28.41
  Bottom 0.254: v31.11,28.41 v41.27,28.41 43.81,28.41 IC5.3 | v41.27,84.29 43.81,84.29 IC20.3 | v41.27,55.08 43.81,55.08 IC15.3
BUFFADDR13  (1 unrouted)
BUFFADDR14  (1 unrouted)
BUFFADDR15  (1 unrouted)
BUSDATA0  (via drill 0.61)  (1 unrouted)
  Top 0.254: IC4.9 136.52,20.79 137.79,22.06 137.79,38.57 136.52,39.84 IC3.9 136.52,44.92 137.79,46.19 137.79,63.97 136.52,65.24 IC2.9 136.52,69.05 137.79,70.32 137.79,83.02 136.52,84.29 v136.52,85.56 IC1.9 | v65.4,22.06 65.4,18.25 IC14.9 | v66.67,29.68 66.67,33.49 65.4,34.76 v65.4,37.3 65.4,42.38 IC13.9 | IC19.9 99.69,20.79 100.96,22.06 v100.96,38.57 99.69,39.84 IC18.9 99.69,44.92 100.96,46.19 v100.96,63.97 99.69,65.24 IC17.9 99.69,70.32 v100.96,71.59 | v65.4,63.97 65.4,67.78 IC12.9 | v65.4,88.1 65.4,91.91 IC11.9 | v84.45,80.48 v84.45,88.1 | v89.53,71.59 v89.53,80.48 v89.53,85.56 | v99.69,85.56 IC16.9
  Bottom 0.254: v65.4,22.06 56.51,22.06 53.97,24.6 53.97,28.41 55.24,29.68 v66.67,29.68 | v100.96,63.97 v65.4,63.97 | v84.45,88.1 v65.4,88.1 | v89.53,80.48 v84.45,80.48 | v100.96,71.59 v89.53,71.59 | v89.53,85.56 v99.69,85.56 v136.52,85.56 | v65.4,37.3 81.91,37.3 83.18,38.57 v100.96,38.57
BUSDATA1  (via drill 0.61)  (1 unrouted)
  Top 0.254: v61.59,13.17 61.59,18.25 IC14.10 | v8.25,14.44 8.25,10.63 6.98,9.36 5.71,10.63 5.71,72.86 6.98,74.13 v6.98,79.21 | IC4.10 133.98,23.33 135.25,24.6 135.25,38.57 133.98,39.84 IC3.10 133.98,44.92 135.25,46.19 135.25,53.81 133.98,55.08 IC2.10 133.98,69.05 135.25,70.32 135.25,79.21 133.98,80.48 IC1.10 | IC19.10 v97.15,20.79 98.42,22.06 98.42,38.57 97.15,39.84 IC18.10 v97.15,48.73 98.42,50 98.42,63.97 97.15,65.24 IC17.10 97.15,70.32 98.42,71.59 98.42,79.21 97.15,80.48 IC16.10 | 62.86,42.38 v62.86,50 | v62.86,62.7 62.86,67.78 IC12.10 | v55.24,50 v55.24,62.7 | v47.62,13.17 v47.62,27.14 | v62.86,36.03 62.86,42.38 | 62.86,42.38 IC13.10
  Bottom 0.254: v61.59,13.17 v47.62,13.17 36.19,13.17 34.92,14.44 v8.25,14.44 | v6.98,79.21 4.44,79.21 U$1.3 | v97.15,48.73 93.34,48.73 92.07,50 v62.86,50 v55.24,50 | v55.24,62.7 v62.86,62.7 | v97.15,20.79 132.71,20.79 133.98,19.52 IC4.10 | v47.62,27.14 48.89,28.41 48.89,36.03 v62.86,36.03
BUSDATA2  (via drill 0.61)
  Top 0.254: 132.71,44.92 131.44,43.65 IC3.11 | 132.71,44.92 132.71,55.08 131.44,56.35 v131.44,57.62 131.44,66.51 | 131.44,66.51 132.71,67.78 132.71,91.91 131.44,91.91 IC1.11 | 131.44,66.51 IC2.11 | v60.32,6.82 60.32,18.25 IC14.11 | v93.34,6.82 v93.34,11.9 | v131.44,13.17 IC4.11 131.44,19.52 132.71,20.79 132.71,44.92 | IC19.11 94.61,20.79 95.88,22.06 95.88,29.68 94.61,30.95 v94.61,33.49 IC18.11 94.61,48.73 95.88,50 95.88,55.08 94.61,56.35 v94.61,57.62 IC17.11 94.61,69.05 | v60.32,33.49 60.32,42.38 IC13.11 | v60.32,89.37 60.32,91.91 IC11.11 | IC16.11 v94.61,89.37 95.88,88.1 95.88,70.32 94.61,69.05 | v60.32,71.59 60.32,67.78 IC12.11 | 94.61,69.05 v94.61,74.13 | v8.25,69.05 v8.25,77.94 | v53.97,70.32 v53.97,66.51
  Bottom 0.254: v60.32,6.82 v93.34,6.82 | v93.34,11.9 117.47,11.9 118.74,13.17 v131.44,13.17 | v94.61,33.49 v60.32,33.49 | v94.61,89.37 v60.32,89.37 | v94.61,74.13 76.83,74.13 74.29,71.59 v60.32,71.59 55.24,71.59 v53.97,70.32 | v8.25,77.94 4.44,77.94 U$1.4 | v8.25,69.05 24.76,69.05 26.03,67.78 46.35,67.78 47.62,66.51 v53.97,66.51 | v131.44,57.62 v94.61,57.62
BUSDATA3  (via drill 0.61)  (3 unrouted)
  Top 0.254: IC4.13 128.9,14.44 127.63,15.71 127.63,20.79 128.9,22.06 IC3.13 128.9,38.57 127.63,39.84 127.63,44.92 128.9,46.19 IC2.13 128.9,63.97 127.63,65.24 127.63,69.05 128.9,70.32 IC1.13 | 92.07,4.28 v94.61,6.82 | v86.99,28.41 86.99,13.17 92.07,8.09 92.07,4.28 | IC19.13 92.07,4.28 | IC14.13 57.78,3.01 57.78,13.17 55.24,15.71 55.24,25.87 56.51,27.14 IC13.13 57.78,27.14 57.78,37.3 55.24,39.84 55.24,44.92 57.78,47.46 57.78,52.54 | 57.78,52.54 57.78,62.7 55.24,65.24 55.24,70.32 57.78,72.86 57.78,76.67 IC11.13 | 57.78,52.54 IC12.13 | IC16.13 92.07,71.59 90.8,70.32 90.8,65.24 92.07,63.97 IC17.13
  Bottom 0.254: v94.61,6.82 106.04,6.82 107.31,5.55 122.55,5.55 125.09,3.01 IC4.13 | v86.99,28.41 92.07,28.41 IC18.13
BUSDATA4  (via drill 0.61)
  Top 0.254: v59.05,5.55 59.05,3.01 IC14.14 | v38.73,22.06 v38.73,5.55 | v8.25,22.06 8.25,37.3 6.98,38.57 v6.98,72.86 | IC19.14 94.61,5.55 95.88,6.82 95.88,13.17 93.34,15.71 93.34,20.79 94.61,22.06 IC18.14 | v60.32,32.22 60.32,27.14 IC13.14 | v89.53,25.87 v89.53,32.22 89.53,38.57 90.8,39.84 90.8,44.92 92.07,46.19 92.07,47.46 94.61,50 IC17.14 | 59.05,52.54 v59.05,47.46 | v81.91,46.19 83.18,47.46 84.45,47.46 86.99,44.92 86.99,39.84 85.72,38.57 v85.72,32.22 | v60.32,74.13 60.32,76.67 IC11.14 | IC4.14 131.44,4.28 130.17,4.28 130.17,20.79 131.44,22.06 IC3.14 v131.44,32.22 131.44,38.57 130.17,39.84 130.17,44.92 131.44,46.19 IC2.14 v131.44,55.08 | v130.17,65.24 130.17,69.05 131.44,70.32 IC1.14 131.44,79.21 v130.17,80.48 | v132.71,56.35 v132.71,65.24 | v94.61,80.48 IC16.14 | v19.68,74.13 22.22,74.13 v22.22,71.59 | v34.92,71.59 v34.92,65.24 | v59.05,63.97 59.05,52.54 | 59.05,52.54 IC12.14
  Bottom 0.254: v38.73,5.55 v59.05,5.55 | v8.25,22.06 v38.73,22.06 | U$1.6 4.44,72.86 v6.98,72.86 17.14,72.86 18.41,74.13 v19.68,74.13 | v60.32,32.22 v85.72,32.22 v89.53,32.22 v131.44,32.22 | v89.53,25.87 90.8,24.6 93.34,24.6 94.61,25.87 IC18.14 | v59.05,47.46 71.75,47.46 73.02,46.19 v81.91,46.19 | v60.32,74.13 75.56,74.13 76.83,75.4 93.34,75.4 94.61,76.67 IC16.14 | v132.71,65.24 v130.17,65.24 | v131.44,55.08 v132.71,56.35 | v130.17,80.48 v94.61,80.48 | v22.22,71.59 v34.92,71.59 | v34.92,65.24 37.46,65.24 38.73,63.97 v59.05,63.97
BUSDATA5  (via drill 0.61)  (10 unrouted)
  Top 0.254: IC19.15 97.15,14.44 95.88,15.71 95.88,20.79 97.15,22.06 v97.15,24.6 IC18.15 | v62.86,5.55 62.86,3.01 IC14.15 | v69.21,5.55 69.21,6.82 70.48,8.09 v70.48,10.63 | v76.83,10.63 v76.83,15.71 | v88.26,15.71 88.26,13.17 89.53,11.9 90.8,13.17 90.8,20.79 92.07,22.06 v92.07,23.33
  Bottom 0.254: v62.86,5.55 v69.21,5.55 | v70.48,10.63 v76.83,10.63 | v76.83,15.71 v88.26,15.71 | v92.07,23.33 93.34,23.33 94.61,24.6 v97.15,24.6
BUSDATA6  (via drill 0.61)  (1 unrouted)
  Top 0.254: v65.4,10.63 65.4,3.01 IC14.16 | v40,23.33 v40,10.63 | v12.06,6.82 v12.06,23.33 | v4.44,6.82 4.44,8.09 3.17,9.36 3.17,66.51 4.44,67.78 U$1.8 | v64.13,37.3 64.13,34.76 65.4,33.49 65.4,27.14 IC13.16 | v53.97,37.3 v53.97,44.92 | v64.13,44.92 64.13,52.54 IC12.16 | 98.42,15.71 98.42,20.79 99.69,22.06 IC18.16 99.69,38.57 v98.42,39.84 98.42,44.92 99.69,46.19 IC17.16 99.69,63.97 98.42,65.24 98.42,70.32 99.69,71.59 IC16.16 | 98.42,15.71 99.69,14.44 IC19.16 | IC4.16 136.52,14.44 135.25,15.71 135.25,20.79 136.52,22.06 IC3.16 136.52,38.57 v135.25,39.84 135.25,44.92 136.52,46.19 IC2.16 136.52,63.97 135.25,65.24 135.25,69.05 136.52,70.32 IC1.16 | v79.37,10.63 v79.37,13.17 | v98.42,14.44 98.42,15.71
  Bottom 0.254: v40,10.63 v65.4,10.63 69.21,10.63 70.48,9.36 76.83,9.36 78.1,10.63 v79.37,10.63 | v12.06,23.33 v40,23.33 | v4.44,6.82 v12.06,6.82 | v53.97,37.3 v64.13,37.3 65.4,38.57 81.91,38.57 83.18,39.84 v98.42,39.84 v135.25,39.84 | v53.97,44.92 v64.13,44.92 | v79.37,13.17 81.91,13.17 83.18,14.44 v98.42,14.44
BUSDATA7  (via drill 0.61)  (4 unrouted)
  Top 0.254: IC19.17 102.23,4.28 100.96,4.28 v100.96,5.55 100.96,20.79 102.23,22.06 IC18.17 v102.23,30.95 | v67.94,14.44 67.94,3.01 IC14.17 | v81.91,14.44 v81.91,5.55 | v10.79,65.24 10.79,88.1 12.06,89.37 v12.06,91.91 | v20.95,91.91 v28.57,91.91 | v45.08,93.18 v46.35,91.91 | v53.97,91.91 v53.97,88.1 | v67.94,86.83 67.94,77.94 IC11.17 | IC4.17 139.06,14.44 137.79,15.71 137.79,20.79 139.06,22.06 IC3.17 139.06,38.57 137.79,39.84 137.79,44.92 139.06,46.19 IC2.17 139.06,63.97 137.79,65.24 137.79,69.05 139.06,70.32 IC1.17 | v67.94,36.03 67.94,27.14 IC13.17 | v73.02,30.95 v73.02,36.03 | IC16.17 102.23,71.59 100.96,70.32 100.96,65.24 102.23,63.97 IC17.17
  Bottom 0.254: v67.94,14.44 v81.91,14.44 | v81.91,5.55 v100.96,5.55 | v10.79,65.24 4.44,65.24 U$1.9 | v12.06,91.91 v20.95,91.91 | v28.57,91.91 36.19,91.91 37.46,90.64 38.73,90.64 41.27,93.18 v45.08,93.18 | v46.35,91.91 v53.97,91.91 | v53.97,88.1 55.24,88.1 56.51,86.83 v67.94,86.83 | v73.02,36.03 v67.94,36.03 | v102.23,30.95 v73.02,30.95
GND  (via drill 0.61)
  Top 0.254: 93.34,38.57 93.34,22.06 92.07,20.79 IC19.12 | 93.34,38.57 92.07,39.84 IC18.12 | IC4.12 128.9,20.79 130.17,22.06 130.17,38.57 128.9,39.84 IC3.12 v128.9,44.92 130.17,46.19 130.17,63.97 128.9,65.24 IC2.12 128.9,69.05 130.17,70.32 130.17,79.21 128.9,80.48 IC1.12 | v93.34,44.92 93.34,38.57 | v43.81,9.36 IC5.8 | v59.05,9.36 59.05,13.17 57.78,14.44 57.78,18.25 IC14.12 | v13.33,70.32 14.6,69.05 IC10.8 | v89.53,69.05 88.26,70.32 v88.26,93.18 | v57.78,38.57 57.78,42.38 IC13.12 | IC15.8 v43.81,38.57 | v47.62,93.18 v47.62,70.32 v47.62,67.78 v47.62,42.38 47.62,39.84 48.89,38.57 v48.89,15.71 | v56.51,65.24 56.51,67.78 IC12.12 | v95.88,44.92 95.88,48.73 v97.15,50 | v93.34,50 93.34,69.05 92.07,69.05 IC17.12
  Bottom 0.254: v128.9,44.92 v95.88,44.92 v93.34,44.92 | U$1.30 4.44,10.63 5.71,9.36 v43.81,9.36 v59.05,9.36 | 43.81,70.32 v13.33,70.32 | v89.53,69.05 92.07,69.05 IC17.12 92.07,66.51 90.8,65.24 v56.51,65.24 | v88.26,93.18 92.07,93.18 IC16.12 | v47.62,42.38 43.81,42.38 IC15.8 | v47.62,67.78 IC12.12 | v43.81,38.57 v57.78,38.57 | v47.62,93.18 56.51,93.18 IC11.12 | v47.62,70.32 43.81,70.32 | 43.81,70.32 IC20.8 | v48.89,15.71 43.81,15.71 IC5.8 | v93.34,50 v97.15,50
N$1  (1 unrouted)
N$2  (1 unrouted)
N$3  (1 unrouted)
N$4  (1 unrouted)
N$5  (1 unrouted)
  Top 0.254: IC9.5 23.49,20.79 22.22,19.52 22.22,15.71 23.49,14.44 IC6.5
N$6  (1 unrouted)
  Top 0.254: SV1.5 SV1.7 SV1.9
  Bottom 0.254: SV1.1 SV1.3 SV1.5 | SV1.9 SV1.11 SV1.13 SV1.15
N$7  (via drill 0.61)
  Top 0.254: v10.79,50 v10.79,53.81 | v28.57,55.08 28.57,52.54 IC7.3
  Bottom 0.254: v10.79,50 4.44,50 U$1.15 | v10.79,53.81 12.06,53.81 13.33,55.08 v28.57,55.08
N$8  (via drill 0.61)
  Top 0.254: v23.49,48.73 23.49,52.54 IC7.5
  Bottom 0.254: v23.49,48.73 13.33,48.73 12.06,47.46 4.44,47.46 U$1.16
N$9  (via drill 0.61)
  Top 0.254: v18.41,47.46 18.41,52.54 IC7.7
  Bottom 0.254: v18.41,47.46 13.33,47.46 10.79,44.92 4.44,44.92 U$1.17
N$10
  Bottom 0.254: IC7.9 12.06,44.92 10.79,43.65 9.52,43.65 8.25,42.38 4.44,42.38 U$1.18
N$11  (via drill 0.61)
  Top 0.254: v20.95,42.38 20.95,44.92 IC7.11
  Bottom 0.254: v20.95,42.38 9.52,42.38 6.98,39.84 4.44,39.84 U$1.19
N$12  (1 unrouted)
N$13  (1 unrouted)
N$14  (via drill 0.61)
  Top 0.254: v24.76,34.76 24.76,38.57 IC8.5
  Bottom 0.254: v24.76,34.76 12.06,34.76 9.52,32.22 9.52,30.95 10.79,29.68 9.52,28.41 6.98,30.95 4.44,30.95 U$1.22
N$15  (1 unrouted)
N$16  (1 unrouted)
N$17  (1 unrouted)
N$18  (1 unrouted)
N$19  (1 unrouted)
  Top 0.254: SV2.3 SV2.5 SV2.7 SV2.9 SV2.11
  Bottom 0.254: SV2.11 SV2.13 SV2.15 | SV2.1 SV2.3
N$20  (1 unrouted)
N$21  (1 unrouted)
N$22  (1 unrouted)
N$23  (1 unrouted)
N$24  (via drill 0.61)
  Top 0.254: 24.76,75.4 22.22,75.4 SV3.5 | v41.27,89.37 41.27,86.83 37.46,83.02 v37.46,76.67 | 24.76,75.4 27.3,75.4 SV3.9 | 24.76,75.4 SV3.7
  Bottom 0.254: 19.68,76.67 17.14,76.67 SV3.1 | 19.68,76.67 22.22,76.67 SV3.5 | 19.68,76.67 SV3.3 | 29.84,76.67 27.3,76.67 SV3.9 | 32.38,76.67 34.92,76.67 | v41.27,89.37 43.81,89.37 IC20.1 | 34.92,76.67 v37.46,76.67 | 34.92,76.67 SV3.15 | 29.84,76.67 32.38,76.67 | 29.84,76.67 SV3.11 | 32.38,76.67 SV3.13
N$25  (via drill 0.61)
  Top 0.254: v9.52,41.11 v9.52,51.27 | v37.46,27.14 v37.46,42.38
  Bottom 0.254: v9.52,51.27 4.44,51.27 U$1.14 | v9.52,41.11 26.03,41.11 27.3,42.38 v37.46,42.38 | v37.46,27.14 29.84,27.14 28.57,28.41 19.68,28.41 18.41,29.68 17.14,29.68 15.87,30.95 IC8.9
N$26  (via drill 0.61)
  Top 0.254: v19.68,36.03 19.68,38.57 IC8.7 | v12.06,36.03 v12.06,55.08
  Bottom 0.254: v12.06,36.03 v19.68,36.03 | v12.06,55.08 4.44,55.08 U$1.13
N$27  (1 unrouted)
  Top 0.254: IC10.4 24.76,66.51 22.22,66.51 IC10.5
RD  (via drill 0.61)  (7 unrouted)
  Top 0.254: v74.29,8.09 74.29,3.01 IC14.20 | v109.85,8.09 IC19.20 | IC4.20 146.68,14.44 145.41,15.71 145.41,20.79 146.68,22.06 IC3.20 146.68,38.57 145.41,39.84 145.41,44.92 146.68,46.19 IC2.20 146.68,63.97 145.41,65.24 145.41,69.05 146.68,70.32 IC1.20 | IC16.20 109.85,71.59 108.58,70.32 108.58,65.24 109.85,63.97 IC17.20
  Bottom 0.254: v74.29,8.09 v109.85,8.09
VCC  (via drill 0.61)  (4 unrouted)
  Top 0.254: IC6.6 20.95,14.44 19.68,15.71 19.68,20.79 20.95,22.06 IC9.6 20.95,30.95 IC8.11 | IC5.16 51.43,37.3 48.89,39.84 v48.89,41.11 v48.89,60.16 v48.89,89.37 | v32.38,62.7 IC10.16 | IC15.16 v51.43,62.7 | v19.68,62.7 IC10.6 v19.68,71.59 | v14.6,71.59 v14.6,85.56 | v29.84,34.76 29.84,32.22 IC8.14 | v42.54,34.76 v42.54,39.84 | IC19.24 v120.01,8.09 120.01,14.44 118.74,15.71 118.74,20.79 120.01,22.06 IC18.24 120.01,38.57 118.74,39.84 118.74,44.92 120.01,46.19 IC17.24 120.01,63.97 118.74,65.24 118.74,70.32 120.01,71.59 IC16.24 | v86.99,11.9 85.72,10.63 85.72,3.01 IC14.24 | v111.12,13.17 v111.12,8.09 | IC4.24 156.84,14.44 155.57,15.71 155.57,20.79 156.84,22.06 IC3.24 156.84,38.57 155.57,39.84 155.57,44.92 156.84,46.19 IC2.24 156.84,63.97 155.57,65.24 155.57,69.05 156.84,70.32 IC1.24 | IC11.24 85.72,76.67 85.72,71.59 86.99,70.32 86.99,65.24 85.72,63.97 85.72,52.54 IC12.24
  Bottom 0.254: IC8.14 28.57,30.95 28.57,29.68 22.22,29.68 20.95,30.95 IC8.11 | v48.89,60.16 51.43,60.16 IC15.16 | v51.43,62.7 v32.38,62.7 v19.68,62.7 | v14.6,85.56 4.44,85.56 U$1.1 | v19.68,71.59 v14.6,71.59 | v48.89,89.37 51.43,89.37 IC20.16 | v29.84,34.76 v42.54,34.76 | v42.54,39.84 46.35,39.84 47.62,41.11 v48.89,41.11 | v86.99,11.9 92.07,11.9 93.34,13.17 v111.12,13.17 | v111.12,8.09 v120.01,8.09
VDD
  Top 0.254: IC6.16 33.65,8.09 32.38,9.36 32.38,14.44 33.65,15.71 IC9.16 33.65,20.79 36.19,23.33 36.19,42.38 | 36.19,42.38 36.19,46.19 33.65,48.73 33.65,52.54 IC7.1 | 36.19,42.38 34.92,41.11 34.92,39.84 IC8.1
VSS  (via drill 0.61)
  Top 0.254: IC6.8 15.87,14.44 14.6,15.71 14.6,19.52 15.87,20.79 IC9.8 15.87,28.41 13.33,30.95 v13.33,39.84 13.33,51.27 14.6,52.54 IC7.8
  Bottom 0.254: v13.33,39.84 15.87,39.84 IC8.8
WR  (6 unrouted)
  Top 0.254: IC19.21 112.39,14.44 111.12,15.71 111.12,20.79 112.39,22.06 IC18.21 112.39,38.57 111.12,39.84 111.12,44.92 112.39,46.19 IC17.21 112.39,63.97 111.12,65.24 111.12,70.32 112.39,71.59 IC16.21 | IC4.21 149.22,14.44 147.95,15.71 147.95,20.79 149.22,22.06 IC3.21 149.22,38.57 147.95,39.84 147.95,44.92 149.22,46.19 IC2.21 149.22,63.97 147.95,65.24 147.95,69.05 149.22,70.32 IC1.21